# Altium schematic sheet SPI_Muxes.SchDoc: SPI_Muxes
size A3; Organization: Altium Limited; Address1: L3, 12a Rodborough Rd; Address2: Frenchs Forest; Address3: NSW; Address4: Australia 2086
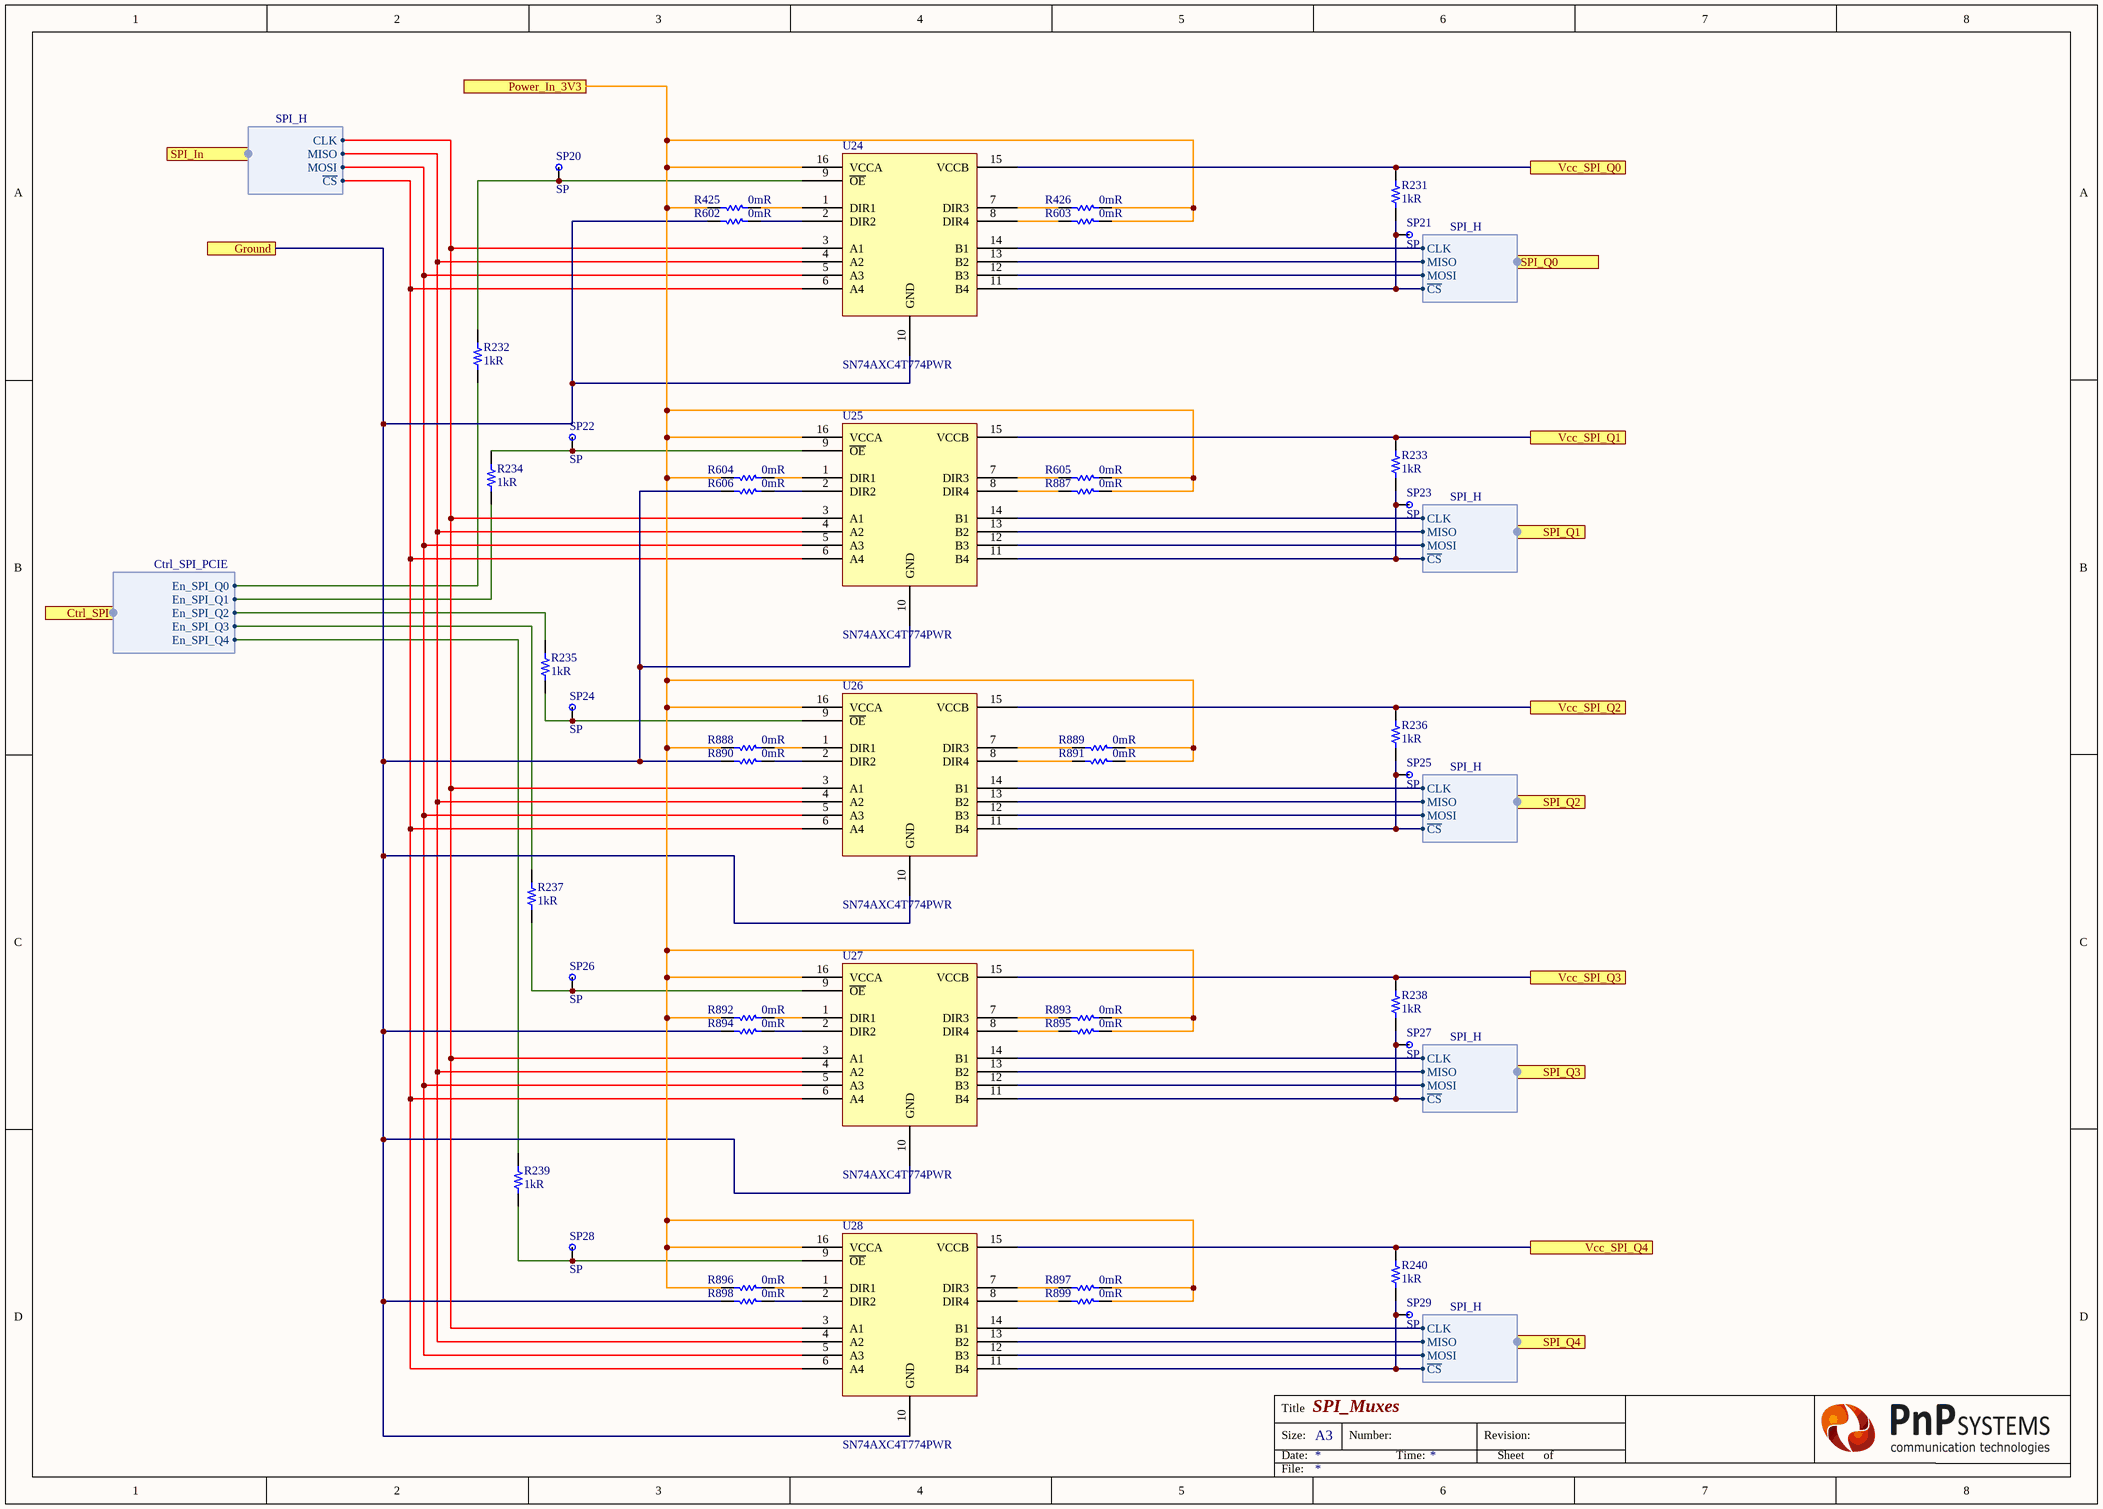
[diagram p0: SPI_Muxes.SchDoc]

## Parts
R231  1kR  [RES 0402/1005 RF KK]
R232  1kR  [RES 0402/1005 RF KK]
R233  1kR  [RES 0402/1005 RF KK]
R234  1kR  [RES 0402/1005 RF KK]
R235  1kR  [RES 0402/1005 RF KK]
R236  1kR  [RES 0402/1005 RF KK]
R237  1kR  [RES 0402/1005 RF KK]
R238  1kR  [RES 0402/1005 RF KK]
R239  1kR  [RES 0402/1005 RF KK]
R240  1kR  [RES 0402/1005 RF KK]
R425  0mR  [RES 0402/1005 RF KK]
R426  0mR  [RES 0402/1005 RF KK]
R602  0mR  [RES 0402/1005 RF KK]
R603  0mR  [RES 0402/1005 RF KK]
R604  0mR  [RES 0402/1005 RF KK]
R605  0mR  [RES 0402/1005 RF KK]
R606  0mR  [RES 0402/1005 RF KK]
R887  0mR  [RES 0402/1005 RF KK]
R888  0mR  [RES 0402/1005 RF KK]
R889  0mR  [RES 0402/1005 RF KK]
R890  0mR  [RES 0402/1005 RF KK]
R891  0mR  [RES 0402/1005 RF KK]
R892  0mR  [RES 0402/1005 RF KK]
R893  0mR  [RES 0402/1005 RF KK]
R894  0mR  [RES 0402/1005 RF KK]
R895  0mR  [RES 0402/1005 RF KK]
R896  0mR  [RES 0402/1005 RF KK]
R897  0mR  [RES 0402/1005 RF KK]
R898  0mR  [RES 0402/1005 RF KK]
R899  0mR  [RES 0402/1005 RF KK]
SP20  SP  [MeasureTP]
SP21  SP  [MeasureTP]
SP22  SP  [MeasureTP]
SP23  SP  [MeasureTP]
SP24  SP  [MeasureTP]
SP25  SP  [MeasureTP]
SP26  SP  [MeasureTP]
SP27  SP  [MeasureTP]
SP28  SP  [MeasureTP]
SP29  SP  [MeasureTP]
U24  SN74AXC4T774PWR  [SN74AXC4T774PWR]
U25  SN74AXC4T774PWR  [SN74AXC4T774PWR]
U26  SN74AXC4T774PWR  [SN74AXC4T774PWR]
U27  SN74AXC4T774PWR  [SN74AXC4T774PWR]
U28  SN74AXC4T774PWR  [SN74AXC4T774PWR]

## Ports
Ctrl_SPI (harness Ctrl_SPI_PCIE), Ground, Power_In_3V3, SPI_In (harness SPI_H), SPI_Q0 (harness SPI_H), SPI_Q1 (harness SPI_H), SPI_Q2 (harness SPI_H), SPI_Q3 (harness SPI_H), SPI_Q4 (harness SPI_H), Vcc_SPI_Q0, Vcc_SPI_Q1, Vcc_SPI_Q2, Vcc_SPI_Q3, Vcc_SPI_Q4

## Harnesses
SPI_H: CLK, MISO, MOSI, ~{CS}
Ctrl_SPI_PCIE: En_SPI_Q0, En_SPI_Q1, En_SPI_Q2, En_SPI_Q3, En_SPI_Q4

## Nets
Ground: R602.2 R606.2 R890.2 R894.2 R898.2 U24.10(GND) U25.10(GND) U26.10(GND) U27.10(GND) U28.10(GND) ; port Ground
Power_In_3V3: R425.2 R426.1 R603.1 R604.2 R605.1 R887.1 R888.2 R889.1 R891.1 R892.2 R893.1 R895.1 R896.2 R897.1 R899.1 U24.16(VCCA) U25.16(VCCA) U26.16(VCCA) U27.16(VCCA) U28.16(VCCA) ; port Power_In_3V3
Vcc_SPI_Q0: R231.2 U24.15(VCCB) ; port Vcc_SPI_Q0
Vcc_SPI_Q1: R233.2 U25.15(VCCB) ; port Vcc_SPI_Q1
Vcc_SPI_Q2: R236.2 U26.15(VCCB) ; port Vcc_SPI_Q2
Vcc_SPI_Q3: R238.2 U27.15(VCCB) ; port Vcc_SPI_Q3
Vcc_SPI_Q4: R240.2 U28.15(VCCB) ; port Vcc_SPI_Q4
NetR231_1: R231.1 SP21.1 U24.11(B4) ; port SPI_Q0.~{CS}
NetR232_1: R232.1 ; port Ctrl_SPI.En_SPI_Q0
NetR232_2: R232.2 SP20.1 U24.9(~{OE})
NetR233_1: R233.1 SP23.1 U25.11(B4) ; port SPI_Q1.~{CS}
NetR234_1: R234.1 ; port Ctrl_SPI.En_SPI_Q1
NetR234_2: R234.2 SP22.1 U25.9(~{OE})
NetR235_1: R235.1 SP24.1 U26.9(~{OE})
NetR235_2: R235.2 ; port Ctrl_SPI.En_SPI_Q2
NetR236_1: R236.1 SP25.1 U26.11(B4) ; port SPI_Q2.~{CS}
NetR237_1: R237.1 SP26.1 U27.9(~{OE})
NetR237_2: R237.2 ; port Ctrl_SPI.En_SPI_Q3
NetR238_1: R238.1 SP27.1 U27.11(B4) ; port SPI_Q3.~{CS}
NetR239_1: R239.1 ; port Ctrl_SPI.En_SPI_Q4
NetR239_2: R239.2 SP28.1 U28.9(~{OE})
NetR240_1: R240.1 SP29.1 U28.11(B4) ; port SPI_Q4.~{CS}
NetR425_1: R425.1 U24.1(DIR1)
NetR426_2: R426.2 U24.7(DIR3)
NetR602_1: R602.1 U24.2(DIR2)
NetR603_2: R603.2 U24.8(DIR4)
NetR604_1: R604.1 U25.1(DIR1)
NetR605_2: R605.2 U25.7(DIR3)
NetR606_1: R606.1 U25.2(DIR2)
NetR887_2: R887.2 U25.8(DIR4)
NetR888_1: R888.1 U26.1(DIR1)
NetR889_2: R889.2 U26.7(DIR3)
NetR890_1: R890.1 U26.2(DIR2)
NetR891_2: R891.2 U26.8(DIR4)
NetR892_1: R892.1 U27.1(DIR1)
NetR893_2: R893.2 U27.7(DIR3)
NetR894_1: R894.1 U27.2(DIR2)
NetR895_2: R895.2 U27.8(DIR4)
NetR896_1: R896.1 U28.1(DIR1)
NetR897_2: R897.2 U28.7(DIR3)
NetR898_1: R898.1 U28.2(DIR2)
NetR899_2: R899.2 U28.8(DIR4)
NetU24_3: U24.3(A1) U25.3(A1) U26.3(A1) U27.3(A1) U28.3(A1) ; port SPI_In.CLK
NetU24_4: U24.4(A2) U25.4(A2) U26.4(A2) U27.4(A2) U28.4(A2) ; port SPI_In.MISO
NetU24_5: U24.5(A3) U25.5(A3) U26.5(A3) U27.5(A3) U28.5(A3) ; port SPI_In.MOSI
NetU24_6: U24.6(A4) U25.6(A4) U26.6(A4) U27.6(A4) U28.6(A4) ; port SPI_In.~{CS}
NetU24_12: U24.12(B3) ; port SPI_Q0.MOSI
NetU24_13: U24.13(B2) ; port SPI_Q0.MISO
NetU24_14: U24.14(B1) ; port SPI_Q0.CLK
NetU25_12: U25.12(B3) ; port SPI_Q1.MOSI
NetU25_13: U25.13(B2) ; port SPI_Q1.MISO
NetU25_14: U25.14(B1) ; port SPI_Q1.CLK
NetU26_12: U26.12(B3) ; port SPI_Q2.MOSI
NetU26_13: U26.13(B2) ; port SPI_Q2.MISO
NetU26_14: U26.14(B1) ; port SPI_Q2.CLK
NetU27_12: U27.12(B3) ; port SPI_Q3.MOSI
NetU27_13: U27.13(B2) ; port SPI_Q3.MISO
NetU27_14: U27.14(B1) ; port SPI_Q3.CLK
NetU28_12: U28.12(B3) ; port SPI_Q4.MOSI
NetU28_13: U28.13(B2) ; port SPI_Q4.MISO
NetU28_14: U28.14(B1) ; port SPI_Q4.CLK

## Notes on the sheet
- Title
- Size:
- Date:
- A3
- Number:
- Time:
- Revision:
- Sheet
- of
- File:

## Library data of the parts
R231-R240 = Resistor: Manufacturer: Panasonic; Manufacturer Part Number: ERJ-2RKF1001X; Tolerance: 1%; Power Rating: 100mW; Temperature Coefficient: 100ppm/°C; Voltage Rating: 50V; Supplier 1: Digi-Key; Supplier Part Number 1: P1.00KLCT-ND; Stock 1: 6683975; Pricing 1: 1 = 0,10000, 10 = 0,05200, 100 = 0,02130, 1000 = 0,00958, 2500 = 0,00832, 5000 = 0,00687 (USD); RoHS: Yes; Mount: Surface Mount; Case/Package: 0402; Number of Pins: 2; Case Code (Imperial): 0402; Case Code (Metric): 1005; Contact Plating: Tin; Min Operating Temperature: -55°C; Max Operating Temperature: 155°C; Resistance: 1kR; Packaging: Tape and Reel; Composition: Thick Film; Termination: SMD/SMT; Package Quantity: 1; Military Standard: Not; Number of Terminations: 2; Max Power Dissipation: 100mW; Voltage Rating (DC): 50V; Features: Automotive AEC-Q200; Working Voltage: 50V; Length: 1mm; Height: 0.35mm; Width: 0.5mm; Depth: 0.5mm; Radiation Hardening: No; Lead Free: Lead Free; REACH SVHC: No SVHC; ComponentLink1URL: https://datasheet.ciiva.com/11821/0900766b80f80784-11821203.pdf?src-supplier=RSComponents; ComponentLink1Description: https://datasheet.ciiva.com/11821/0900766b80f80784-11821203.pdf?src-supplier=RSComponents; ComponentLink2URL: https://datasheet.ciiva.com/16767/70260748-16767559.pdf?src-supplier=Allied+Electronics; ComponentLink2Description: https://datasheet.ciiva.com/16767/70260748-16767559.pdf?src-supplier=Allied+Electronics; ComponentLink3URL: https://datasheet.ciiva.com/9198/aoa0000ce2-9198920.pdf?src-supplier=Avnet; ComponentLink3Description: https://datasheet.ciiva.com/9198/aoa0000ce2-9198920.pdf?src-supplier=Avnet; ComponentLink4URL: https://datasheet.ciiva.com/7942/aoa0000ce2-7942426.pdf?src-supplier=Element14; ComponentLink4Description: https://datasheet.ciiva.com/7942/aoa0000ce2-7942426.pdf?src-supplier=Element14; ComponentLink5URL: https://datasheet.ciiva.com/16771/70260748-16771979.pdf?src-supplier=Allied+Electronics; ComponentLink5Description: https://datasheet.ciiva.com/16771/70260748-16771979.pdf?src-supplier=Allied+Electronics; ComponentLink6URL: https://datasheet.ciiva.com/17215/aoa0000ce2-17215308.pdf?src-supplier=Avnet+Europe; ComponentLink6Description: https://datasheet.ciiva.com/17215/aoa0000ce2-17215308.pdf?src-supplier=Avnet+Europe; ComponentLink7URL: https://datasheet.ciiva.com/28532/1678782-28532109.pdf?src-supplier=Element14; ComponentLink7Description: https://datasheet.ciiva.com/28532/1678782-28532109.pdf?src-supplier=Element14; ComponentLink8URL: https://datasheet.ciiva.com/16523/aoa0000ce2-16523834.pdf?src-supplier=Avnet+Asia; ComponentLink8Description: https://datasheet.ciiva.com/16523/aoa0000ce2-16523834.pdf?src-supplier=Avnet+Asia; ComponentLink9URL: https://datasheet.ciiva.com/22673/1678782-22673916.pdf?src-supplier=Element14; ComponentLink9Description: https://datasheet.ciiva.com/22673/1678782-22673916.pdf?src-supplier=Element14
R425 R426 R602-R606 R887-R899 = Resistor: Manufacturer 1: Yageo; Manufacturer Part Number 1: RC0402JR-070RL; Power Rating: 62.5mW; Tolerance: 5%; Voltage Rating: 50V; Max Power Dissipation: 63mW; Temperature Coefficient: 200ppm/°C; Supplier 1: Digi-Key; Supplier Part Number 1: 311-0.0JRCT-ND; Stock 1: 69822252; Pricing 1: 1=0.10000, 10=0.01200, 25=0.00920, 50=0.00680, 100=0.00510, 250=0.00388, 500=0.00308, 1000=0.00227, 5000=0.00163 (USD); RoHS: Yes; Case/Package: 0402; Contact Plating: Tin,Matte; Case Code (Metric): 1005; Case Code (Imperial): 0402; Min Operating Temperature: -55°C; Max Operating Temperature: 155°C; Resistance: 0mR; Packaging: Tape and Reel; Composition: Thick Film; Package Quantity: 1; Number of Terminations: 2; Termination: SMD/SMT; Military Standard: Not; Features: Moisture Resistant; Length: 1mm; Height: 0.016inch; Width: 0.02inch; Depth: 0.5mm; Radiation Hardening: No; REACH SVHC: Unknown; Lead Free: Lead Free; ComponentLink1URL: https://datasheet.ciiva.com/2452/pyu-rc0402-51-rohs-l-6-2452608.pdf?src-supplier=Digi-Key; ComponentLink1Description: https://datasheet.ciiva.com/2452/pyu-rc0402-51-rohs-l-6-2452608.pdf?src-supplier=Digi-Key; ComponentLink2URL: https://datasheet.ciiva.com/11808/0900766b80c66297-11808195.pdf?src-supplier=RSComponents; ComponentLink2Description: https://datasheet.ciiva.com/11808/0900766b80c66297-11808195.pdf?src-supplier=RSComponents; ComponentLink3URL: https://datasheet.ciiva.com/2452/pyu-r-int-thick-7-2452609.pdf?src-supplier=Digi-Key; ComponentLink3Description: https://datasheet.ciiva.com/2452/pyu-r-int-thick-7-2452609.pdf?src-supplier=Digi-Key; ComponentLink4URL: https://datasheet.ciiva.com/22747/1018594-22747515.pdf?src-supplier=Element14; ComponentLink4Description: https://datasheet.ciiva.com/22747/1018594-22747515.pdf?src-supplier=Element14; ComponentLink5URL: https://datasheet.ciiva.com/7983/1018594-7983535.pdf?src-supplier=Element14; ComponentLink5Description: https://datasheet.ciiva.com/7983/1018594-7983535.pdf?src-supplier=Element14; ComponentLink6URL: https://datasheet.ciiva.com/2452/pyu-r-int-thick-7-2452610.pdf?src-supplier=Digi-Key; ComponentLink6Description: https://datasheet.ciiva.com/2452/pyu-r-int-thick-7-2452610.pdf?src-supplier=Digi-Key; ComponentLink7URL: https://datasheet.ciiva.com/8896/pyu-rc0402-51-rohs-l-6-8896201.pdf?src-supplier=Avnet; ComponentLink7Description: https://datasheet.ciiva.com/8896/pyu-rc0402-51-rohs-l-6-8896201.pdf?src-supplier=Avnet; ComponentLink8URL: https://datasheet.ciiva.com/28386/pyu-rc0402-51-rohs-l-6-28386633.pdf?src-supplier=Avnet+Europe; ComponentLink8Description: https://datasheet.ciiva.com/28386/pyu-rc0402-51-rohs-l-6-28386633.pdf?src-supplier=Avnet+Europe; ComponentLink9URL: https://datasheet.ciiva.com/15189/getdatasheetpartid-326379-15189533.pdf?src-supplier=Verical; ComponentLink9Description: https://datasheet.ciiva.com/15189/getdatasheetpartid-326379-15189533.pdf?src-supplier=Verical
U24-U28 = SN74AXC4T774PWR: Manufacturer 1: Texas Instruments; Supplier 1: Digi-Key; Manufacturer Part Number 1: SN74AXC4T774PWR; Stock 1: 2000; Pricing 1: 1=1,14000, 10=1,01500, 100=0,79120, 500=0,65364, 1000=0,51603 (USD); RoHS: No; Supplier Part Number 1: 296-SN74AXC4T774PWRCT-ND